# Altium schematic sheet Encoder.SchDoc
size A; SheetNumber: 4; SheetTotal: 4
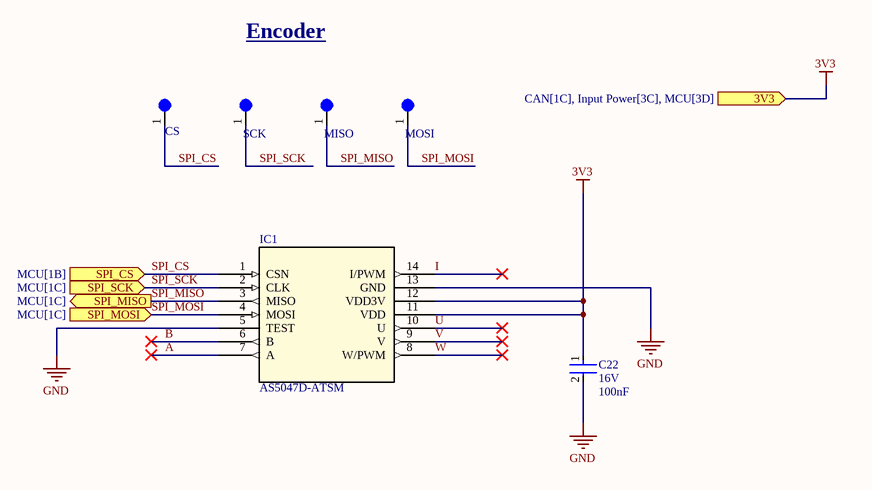
[diagram p0: Encoder.SchDoc]

## Parts
C22  Voltage Rating: 16V  Capacitance: 100nF  [CAP-0603]  (hidden comment: CAP 0603)
CS  5003  [TEST-POINT-0001]  (value not drawn)
IC1  AS5047D-ATSM  [TSSOP14_AMS]
MISO  5003  [TEST-POINT-0001]  (value not drawn)
MOSI  5003  [TEST-POINT-0001]  (value not drawn)
SCK  5003  [TEST-POINT-0001]  (value not drawn)

## Ports
3V3 (in, see CAN[1C], Input Power[3C], MCU[3D]), SPI_CS (in, see MCU[1B]), SPI_MISO (out, see MCU[1C]), SPI_MOSI (in, see MCU[1C]), SPI_SCK (in, see MCU[1C])

## Nets
3V3: C22.1 IC1.11(VDD) IC1.12(VDD3V) ; port 3V3
GND: C22.2 IC1.5(TEST) IC1.13(GND)
A: IC1.7(A)
B: IC1.6(B)
I: IC1.14(I/PWM)
SPI_CS: CS.1 IC1.1(CSN) ; port SPI_CS
SPI_MISO: IC1.3(MISO) MISO.1 ; port SPI_MISO
SPI_MOSI: IC1.4(MOSI) MOSI.1 ; port SPI_MOSI
SPI_SCK: IC1.2(CLK) SCK.1 ; port SPI_SCK
U: IC1.10(U)
V: IC1.9(V)
W: IC1.8(W/PWM)

## Notes on the sheet
- Encoder

## Library data of the parts
CS MISO MOSI SCK = TEST-POINT-0001: Oranange PC Test Point, Miniature Phoisphor Bronze Silver Plating Through Hole Mounting Type
IC1 = AS5047D-ATSM: Description; Manufacturer_Name: ams OSRAM; Copyright: Copyright (C) 2026 Ultra Librarian. All rights reserved.; Manufacturer_Part_Number: AS5047D-ATSM; RefDes: RefDes; Type: Type